# Altium schematic sheet Sheet2.SchDoc
size A3; SheetNumber: 1; SheetTotal: 3
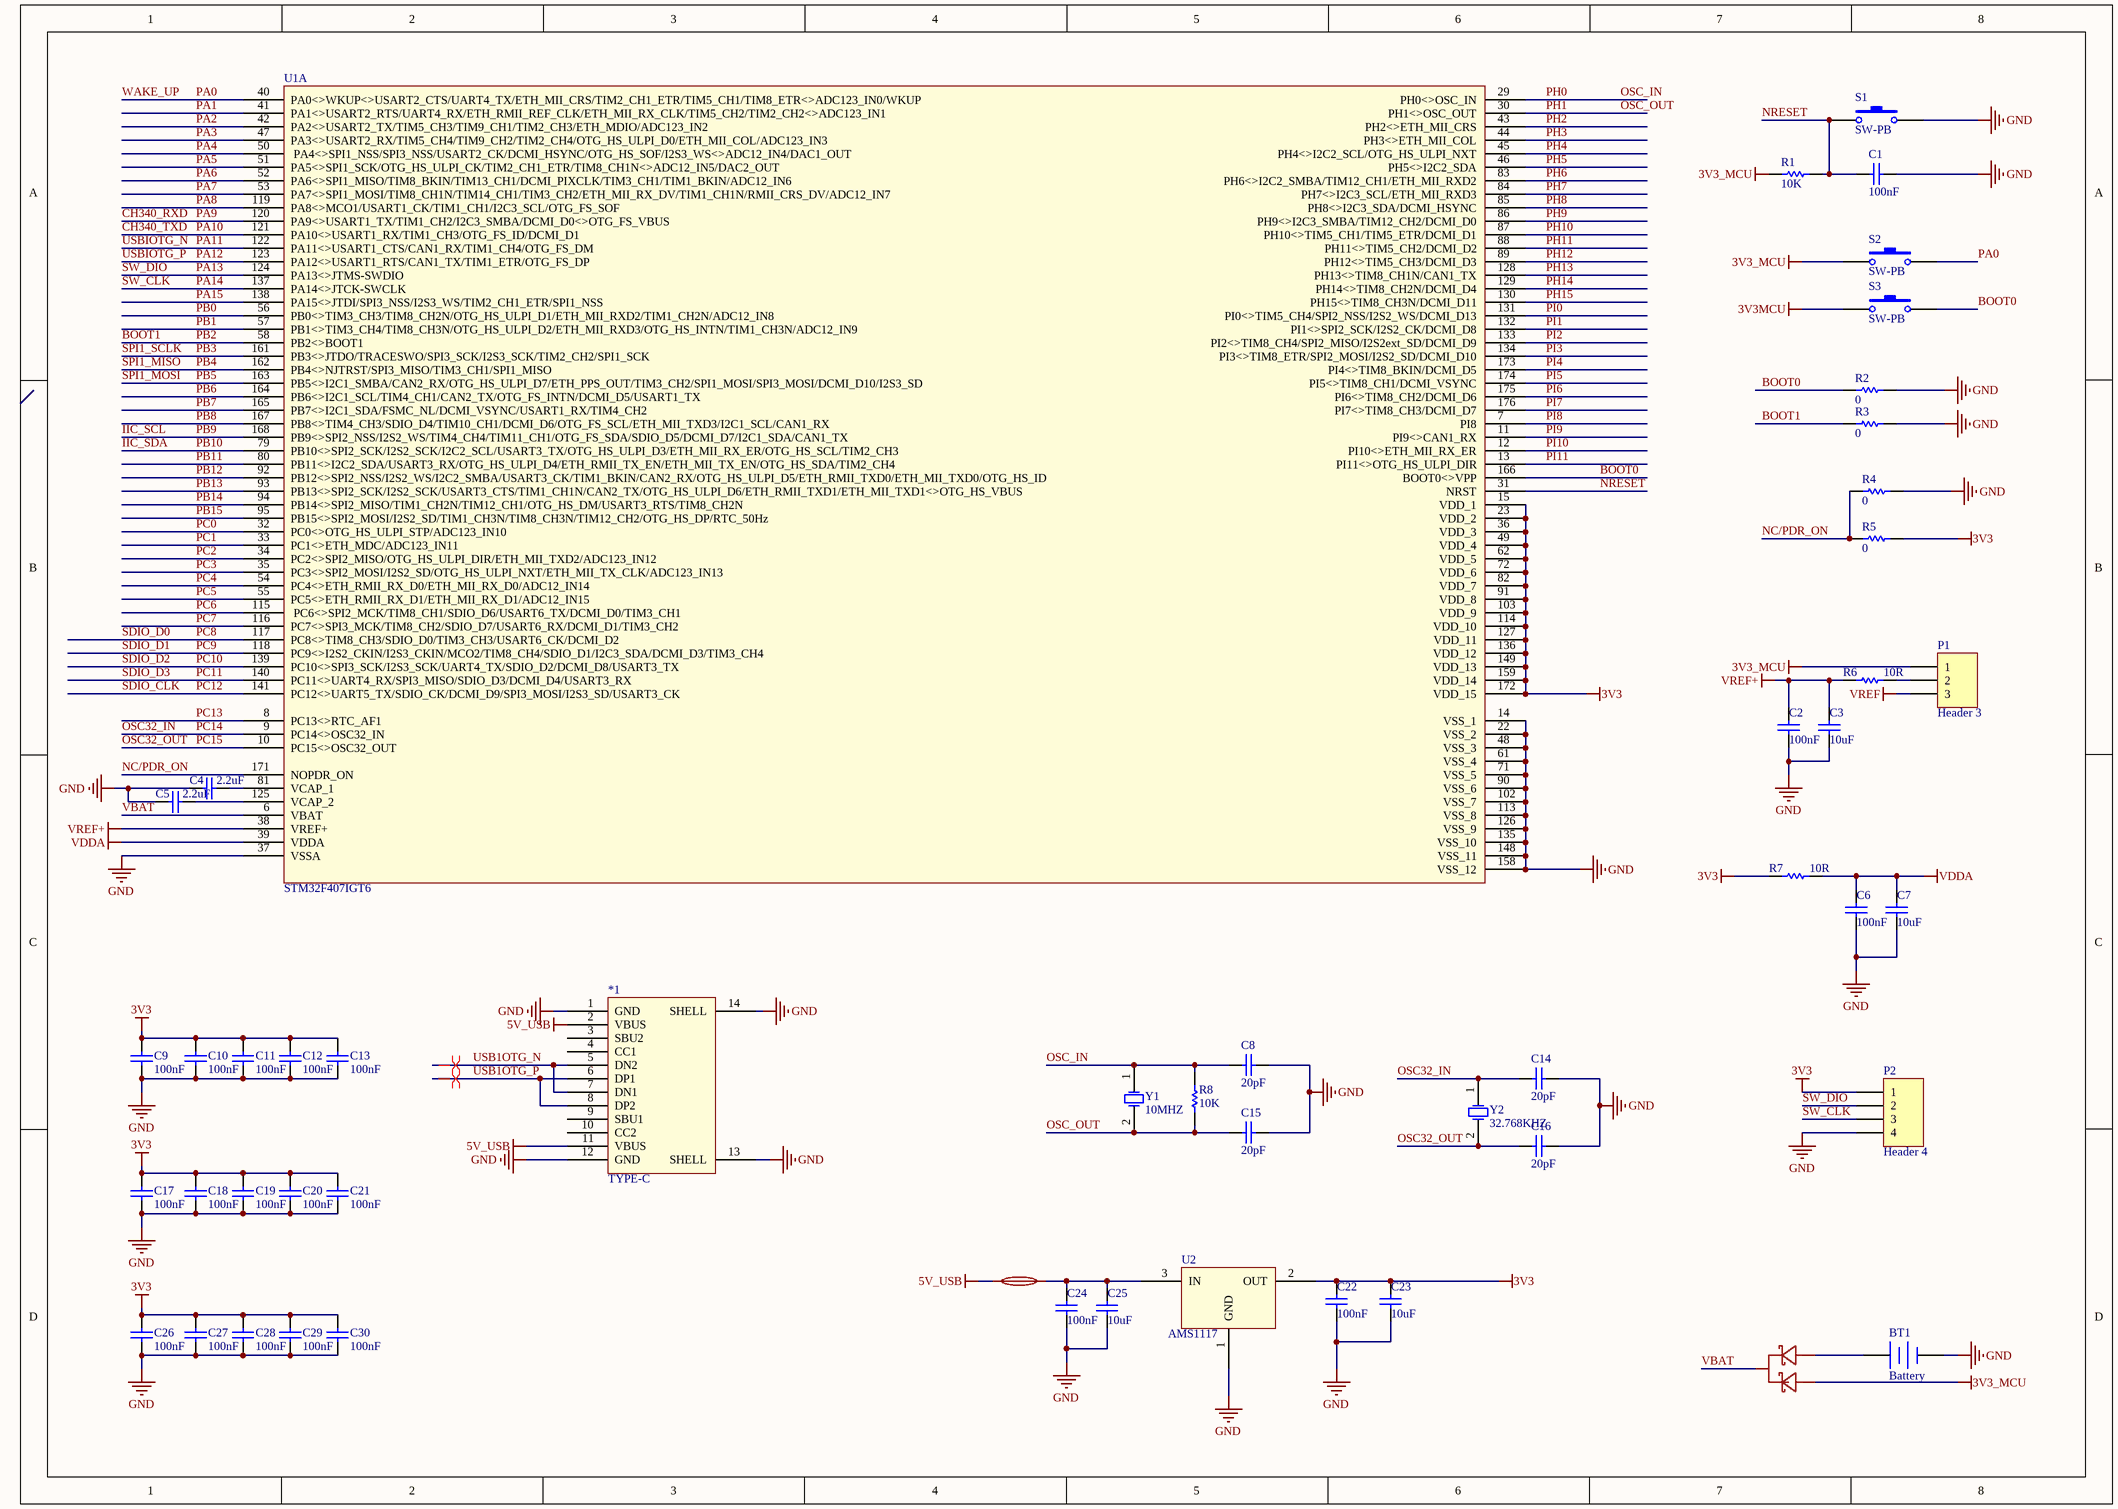
[diagram p0: Sheet2.SchDoc]

## Parts
*1  TYPE-C  [USB-C-SMD_TYPE-C-6PIN-2MD-073]
BT1  Battery  [BAT-SMD_CR1220-2]
C1  100nF  [C0603]
C2  100nF  [C0603]
C3  10uF  [C0603]
C4  2.2uF  [C0603]
C5  2.2uF  [C0603]
C6  100nF  [C0603]
C7  10uF  [C0603]
C8  20pF  [C0603]
C9  100nF  [C0603]
C10  100nF  [C0603]
C11  100nF  [C0603]
C12  100nF  [C0603]
C13  100nF  [C0603]
C14  20pF  [C0603]
C15  20pF  [C0603]
C16  20pF  [C0603]
C17  100nF  [C0603]
C18  100nF  [C0603]
C19  100nF  [C0603]
C20  100nF  [C0603]
C21  100nF  [C0603]
C22  100nF  [C0603]
C23  10uF  [C0603]
C24  100nF  [C0603]
C25  10uF  [C0603]
C26  100nF  [C0603]
C27  100nF  [C0603]
C28  100nF  [C0603]
C29  100nF  [C0603]
C30  100nF  [C0603]
F1  smd1206-100-30  [F1206]  (value not drawn)
P1  Header 3  [HDR1X3]
P2  Header 4  [CONN-SMD_HCZZ0021-4]
R1  10K  [R0603]
R2  0  [R0603]
R3  0  [R0603]
R4  0  [R0603]
R5  0  [R0603]
R6  10R  [R0603]
R7  10R  [R0603]
R8  10K  [R0603]
S1  SW-PB  [KEY-SMD_L6.2-W3.6-LS8.0]
S2  SW-PB  [KEY-SMD_L6.2-W3.6-LS8.0]
S3  SW-PB  [KEY-SMD_L6.2-W3.6-LS8.0]
U1  STM32F407IGT6  [LQFP-176_L24.0-W24.0-P0.50-BL]  (part A of 2)
U2  AMS1117  [SOT-89-3_L4.5-W2.5-P1.50-LS4.2-BR]
U3  bat54c_c22466350  [SOT-23-3_L2.9-W1.3-P1.90-LS2.4-BR]  (value not drawn)
Y1  10MHZ  [CRYSTAL-SMD_L5.0-W3.2]
Y2  32.768KHZ  [CRYSTAL-SMD_L5.0-W3.2]

## Nets
3V3: C9.1 C10.1 C11.1 C12.1 C13.1 C17.1 C18.1 C19.1 C20.1 C21.1 C22.1 C23.1 C26.1 C27.1 C28.1 C29.1 C30.1 P2.1 R5.1 R7.2 U1.15(VDD_1) U1.23(VDD_2) U1.36(VDD_3) U1.49(VDD_4) U1.62(VDD_5) U1.72(VDD_6) U1.82(VDD_7) U1.91(VDD_8) U1.103(VDD_9) U1.114(VDD_10) U1.127(VDD_11) U1.136(VDD_12) U1.149(VDD_13) U1.159(VDD_14) U1.172(VDD_15) U2.2(OUT)
3V3_MCU: P1.1 R1.2 S2.1 U3.1(A)
3V3MCU: S3.1
5V_USB: *1.2(VBUS) *1.11(VBUS) F1.1
GND: *1.1(GND) *1.12(GND) *1.13(SHELL) *1.14(SHELL) BT1.2(-) C1.2 C2.2 C3.2 C4.2 C5.1 C6.2 C7.2 C8.1 C9.2 C10.2 C11.2 C12.2 C13.2 C14.1 C15.1 C16.1 C17.2 C18.2 C19.2 C20.2 C21.2 C22.2 C23.2 C24.2 C25.2 C26.2 C27.2 C28.2 C29.2 C30.2 P2.4 R2.1 R3.1 R4.1 S1.2 U1.14(VSS_1) U1.22(VSS_2) U1.37(VSSA) U1.48(VSS_3) U1.61(VSS_4) U1.71(VSS_5) U1.90(VSS_6) U1.102(VSS_7) U1.113(VSS_8) U1.126(VSS_9) U1.135(VSS_10) U1.148(VSS_11) U1.158(VSS_12) U2.1(GND)
VDDA: C6.1 C7.1 R7.1 U1.39(VDDA)
VREF: P1.3
VREF+: C2.1 C3.1 R6.2 U1.38(VREF+)
BOOT0: R2.2 S3.2 U1.166(BOOT0<>VPP)
BOOT1: R3.2 U1.58(PB2<>BOOT1)  [also labelled PB2]
CH340_RXD: U1.120(PA9<>USART1_TX/TIM1_CH2/I2C3_SMBA/DCMI_D0<>OTG_FS_VBUS)  [also labelled PA9]
CH340_TXD: U1.121(PA10<>USART1_RX/TIM1_CH3/OTG_FS_ID/DCMI_D1)  [also labelled PA10]
IIC_SCL: U1.168(PB9<>SPI2_NSS/I2S2_WS/TIM4_CH4/TIM11_CH1/OTG_FS_SDA/SDIO_D5/DCMI_D7/I2C1_SDA/CAN1_TX)  [also labelled PB9]
IIC_SDA: U1.79(PB10<>SPI2_SCK/I2S2_SCK/I2C2_SCL/USART3_TX/OTG_HS_ULPI_D3/ETH_MII_RX_ER/OTG_HS_SCL/TIM2_CH3)  [also labelled PB10]
NC/PDR_ON: R4.2 R5.2 U1.171(NOPDR_ON)
NRESET: C1.1 R1.1 S1.1 U1.31(NRST)
OSC32_IN: C14.2 U1.9(PC14<>OSC32_IN) Y2.1(OSC1)  [also labelled PC14]
OSC32_OUT: C16.2 U1.10(PC15<>OSC32_OUT) Y2.2(OSC2)  [also labelled PC15]
OSC_IN: C8.2 R8.1 U1.29(PH0<>OSC_IN) Y1.1(OSC1)  [also labelled PH0]
OSC_OUT: C15.2 R8.2 U1.30(PH1<>OSC_OUT) Y1.2(OSC2)  [also labelled PH1]
PA0: S2.2 U1.40(PA0<>WKUP<>USART2_CTS/UART4_TX/ETH_MII_CRS/TIM2_CH1_ETR/TIM5_CH1/TIM8_ETR<>ADC123_IN0/WKUP)  [also labelled WAKE_UP]
PA1: U1.41(PA1<>USART2_RTS/UART4_RX/ETH_RMII_REF_CLK/ETH_MII_RX_CLK/TIM5_CH2/TIM2_CH2<>ADC123_IN1)
PA2: U1.42(PA2<>USART2_TX/TIM5_CH3/TIM9_CH1/TIM2_CH3/ETH_MDIO/ADC123_IN2)
PA3: U1.47(PA3<>USART2_RX/TIM5_CH4/TIM9_CH2/TIM2_CH4/OTG_HS_ULPI_D0/ETH_MII_COL/ADC123_IN3)
PA4: U1.50(PA4<>SPI1_NSS/SPI3_NSS/USART2_CK/DCMI_HSYNC/OTG_HS_SOF/I2S3_WS<>ADC12_IN4/DAC1_OUT)
PA5: U1.51(PA5<>SPI1_SCK/OTG_HS_ULPI_CK/TIM2_CH1_ETR/TIM8_CH1N<>ADC12_IN5/DAC2_OUT)
PA6: U1.52(PA6<>SPI1_MISO/TIM8_BKIN/TIM13_CH1/DCMI_PIXCLK/TIM3_CH1/TIM1_BKIN/ADC12_IN6)
PA7: U1.53(PA7<>SPI1_MOSI/TIM8_CH1N/TIM14_CH1/TIM3_CH2/ETH_MII_RX_DV/TIM1_CH1N/RMII_CRS_DV/ADC12_IN7)
PA8: U1.119(PA8<>MCO1/USART1_CK/TIM1_CH1/I2C3_SCL/OTG_FS_SOF)
PA11: U1.122(PA11<>USART1_CTS/CAN1_RX/TIM1_CH4/OTG_FS_DM)  [also labelled USBIOTG_N]
PA12: U1.123(PA12<>USART1_RTS/CAN1_TX/TIM1_ETR/OTG_FS_DP)  [also labelled USBIOTG_P]
PA13: P2.2 U1.124(PA13<>JTMS-SWDIO)  [also labelled SW_DIO]
PA14: P2.3 U1.137(PA14<>JTCK-SWCLK)  [also labelled SW_CLK]
PA15: U1.138(PA15<>JTDI/SPI3_NSS/I2S3_WS/TIM2_CH1_ETR/SPI1_NSS)
PB0: U1.56(PB0<>TIM3_CH3/TIM8_CH2N/OTG_HS_ULPI_D1/ETH_MII_RXD2/TIM1_CH2N/ADC12_IN8)
PB1: U1.57(PB1<>TIM3_CH4/TIM8_CH3N/OTG_HS_ULPI_D2/ETH_MII_RXD3/OTG_HS_INTN/TIM1_CH3N/ADC12_IN9)
PB3: U1.161(PB3<>JTDO/TRACESWO/SPI3_SCK/I2S3_SCK/TIM2_CH2/SPI1_SCK)  [also labelled SPI1_SCLK]
PB4: U1.162(PB4<>NJTRST/SPI3_MISO/TIM3_CH1/SPI1_MISO)  [also labelled SPI1_MISO]
PB5: U1.163(PB5<>I2C1_SMBA/CAN2_RX/OTG_HS_ULPI_D7/ETH_PPS_OUT/TIM3_CH2/SPI1_MOSI/SPI3_MOSI/DCMI_D10/I2S3_SD)  [also labelled SPI1_MOSI]
PB6: U1.164(PB6<>I2C1_SCL/TIM4_CH1/CAN2_TX/OTG_FS_INTN/DCMI_D5/USART1_TX)
PB7: U1.165(PB7<>I2C1_SDA/FSMC_NL/DCMI_VSYNC/USART1_RX/TIM4_CH2)
PB8: U1.167(PB8<>TIM4_CH3/SDIO_D4/TIM10_CH1/DCMI_D6/OTG_FS_SCL/ETH_MII_TXD3/I2C1_SCL/CAN1_RX)
PB11: U1.80(PB11<>I2C2_SDA/USART3_RX/OTG_HS_ULPI_D4/ETH_RMII_TX_EN/ETH_MII_TX_EN/OTG_HS_SDA/TIM2_CH4)
PB12: U1.92(PB12<>SPI2_NSS/I2S2_WS/I2C2_SMBA/USART3_CK/TIM1_BKIN/CAN2_RX/OTG_HS_ULPI_D5/ETH_RMII_TXD0/ETH_MII_TXD0/OTG_HS_ID)
PB13: U1.93(PB13<>SPI2_SCK/I2S2_SCK/USART3_CTS/TIM1_CH1N/CAN2_TX/OTG_HS_ULPI_D6/ETH_RMII_TXD1/ETH_MII_TXD1<>OTG_HS_VBUS)
PB14: U1.94(PB14<>SPI2_MISO/TIM1_CH2N/TIM12_CH1/OTG_HS_DM/USART3_RTS/TIM8_CH2N)
PB15: U1.95(PB15<>SPI2_MOSI/I2S2_SD/TIM1_CH3N/TIM8_CH3N/TIM12_CH2/OTG_HS_DP/RTC_50Hz)
PC0: U1.32(PC0<>OTG_HS_ULPI_STP/ADC123_IN10)
PC1: U1.33(PC1<>ETH_MDC/ADC123_IN11)
PC2: U1.34(PC2<>SPI2_MISO/OTG_HS_ULPI_DIR/ETH_MII_TXD2/ADC123_IN12)
PC3: U1.35(PC3<>SPI2_MOSI/I2S2_SD/OTG_HS_ULPI_NXT/ETH_MII_TX_CLK/ADC123_IN13)
PC4: U1.54(PC4<>ETH_RMII_RX_D0/ETH_MII_RX_D0/ADC12_IN14)
PC5: U1.55(PC5<>ETH_RMII_RX_D1/ETH_MII_RX_D1/ADC12_IN15)
PC6: U1.115(PC6<>SPI2_MCK/TIM8_CH1/SDIO_D6/USART6_TX/DCMI_D0/TIM3_CH1)
PC7: U1.116(PC7<>SPI3_MCK/TIM8_CH2/SDIO_D7/USART6_RX/DCMI_D1/TIM3_CH2)
PC8: U1.117(PC8<>TIM8_CH3/SDIO_D0/TIM3_CH3/USART6_CK/DCMI_D2)  [also labelled SDIO_D0]
PC9: U1.118(PC9<>I2S2_CKIN/I2S3_CKIN/MCO2/TIM8_CH4/SDIO_D1/I2C3_SDA/DCMI_D3/TIM3_CH4)  [also labelled SDIO_D1]
PC10: U1.139(PC10<>SPI3_SCK/I2S3_SCK/UART4_TX/SDIO_D2/DCMI_D8/USART3_TX)  [also labelled SDIO_D2]
PC11: U1.140(PC11<>UART4_RX/SPI3_MISO/SDIO_D3/DCMI_D4/USART3_RX)  [also labelled SDIO_D3]
PC12: U1.141(PC12<>UART5_TX/SDIO_CK/DCMI_D9/SPI3_MOSI/I2S3_SD/USART3_CK)  [also labelled SDIO_CLK]
PC13: U1.8(PC13<>RTC_AF1)
PH2: U1.43(PH2<>ETH_MII_CRS)
PH3: U1.44(PH3<>ETH_MII_COL)
PH4: U1.45(PH4<>I2C2_SCL/OTG_HS_ULPI_NXT)
PH5: U1.46(PH5<>I2C2_SDA)
PH6: U1.83(PH6<>I2C2_SMBA/TIM12_CH1/ETH_MII_RXD2)
PH7: U1.84(PH7<>I2C3_SCL/ETH_MII_RXD3)
PH8: U1.85(PH8<>I2C3_SDA/DCMI_HSYNC)
PH9: U1.86(PH9<>I2C3_SMBA/TIM12_CH2/DCMI_D0)
PH10: U1.87(PH10<>TIM5_CH1/TIM5_ETR/DCMI_D1)
PH11: U1.88(PH11<>TIM5_CH2/DCMI_D2)
PH12: U1.89(PH12<>TIM5_CH3/DCMI_D3)
PH13: U1.128(PH13<>TIM8_CH1N/CAN1_TX)
PH14: U1.129(PH14<>TIM8_CH2N/DCMI_D4)
PH15: U1.130(PH15<>TIM8_CH3N/DCMI_D11)
PI0: U1.131(PI0<>TIM5_CH4/SPI2_NSS/I2S2_WS/DCMI_D13)
PI1: U1.132(PI1<>SPI2_SCK/I2S2_CK/DCMI_D8)
PI2: U1.133(PI2<>TIM8_CH4/SPI2_MISO/I2S2ext_SD/DCMI_D9)
PI3: U1.134(PI3<>TIM8_ETR/SPI2_MOSI/I2S2_SD/DCMI_D10)
PI4: U1.173(PI4<>TIM8_BKIN/DCMI_D5)
PI5: U1.174(PI5<>TIM8_CH1/DCMI_VSYNC)
PI6: U1.175(PI6<>TIM8_CH2/DCMI_D6)
PI7: U1.176(PI7<>TIM8_CH3/DCMI_D7)
PI8: U1.7(PI8)
PI9: U1.11(PI9<>CAN1_RX)
PI10: U1.12(PI10<>ETH_MII_RX_ER)
PI11: U1.13(PI11<>OTG_HS_ULPI_DIR)
USB1OTG_N: *1.5(DN2) *1.7(DN1)
USB1OTG_P: *1.6(DP1) *1.8(DP2)
VBAT: U1.6(VBAT) U3.3(K)
NetBT1_1: BT1.1(+) U3.2(A)
NetC4_1: C4.1 U1.81(VCAP_1)
NetC5_2: C5.2 U1.125(VCAP_2)
NetC24_1: C24.1 C25.1 F1.2 U2.3(IN)
NetP1_2: P1.2 R6.1

Not connected (* = marked no-connect by the designer): *1 3(SBU2) 4(CC1) 9(SBU1) 10(CC2)

## Layout directives
differential pair: USB1OTG_N, USB1OTG_P

## Library data of the parts
BT1 = Battery: Multicell Battery; Published: 24-Mar-1999; LatestRevisionDate: 17-Jul-2002; LatestRevisionNote: Re-released for DXP Platform.; PackageReference: BAT-2; Publisher: Altium Limited; PackageDescription: Battery; 2 Leads
C1-C30 = Cap: Capacitor; Value: 100pF; Published: 8-Jun-2000; LatestRevisionDate: 17-Jul-2002; LatestRevisionNote: Re-released for DXP Platform.; PackageReference: RAD-0.3; Publisher: Altium Limited; PackageDescription: Radial Cap, Thru-Hole; 2 Leads; 0.3 in Pin Spacing
F1 = smd1206-100-30: 耐压(Vmax):30V;最大电流(Imax):40A;保持电流(Ihold):1A;跳闸电流(Itrip):1.8A;; Manufacturer: R+O(宏嘉诚); AddInBom: yes; ModelId: f1628daad26847a79b887277a2bc8541; ModelName: F1206_L3.2-W1.7-H0.6; ModelTransform: 125.984,66.929,0,0,0,0,0,0,0; Voltage - Max: 30V; Current - Max: 40A; Hold Current: 1A; Trip Current: 1.8A; Power Dissipation: 1W; Resistance - Initial (Ri) (Min): 50mΩ; Resistance - Post Trip (R1) (Max): 300mΩ; Time to Trip(Max): 300ms; Symbol: SMD1206-100-30; LCSC Part Name: 30V 1A; SupplierPart: C46641026; ManufacturerPart: SMD1206-100-30; Supplier Footprint: 1206; JLCPCB Part Class: Extended Part; Datasheet: https://item.szlcsc.com/datasheet/SMD1206-100-30/48798732.html; Supplier: LCSC; ConvertToPcb: yes; FootprintName: F1206; Operating Temperature: -40℃~+85℃; Length: 3.6mm; Width: 1.9mm; Height: 1.3mm
P1 = Header 3: Header, 3-Pin; LatestRevisionDate: 17-Jul-2002; LatestRevisionNote: Re-released for DXP Platform.; Publisher: Altium Limited
P2 = Header 4: Header, 4-Pin; LatestRevisionDate: 17-Jul-2002; LatestRevisionNote: Re-released for DXP Platform.; Publisher: Altium Limited
R1-R8 = Res1: Resistor; Value: 1K; Published: 8-Jun-2000; LatestRevisionDate: 17-Jul-2002; LatestRevisionNote: Re-released for DXP Platform.; PackageReference: AXIAL-0.3; Publisher: Altium Limited; PackageDescription: Axial Device, Thru-Hole; 2 Leads; 0.3 in Pin Spacing
S1-S3 = SW-PB: Switch; Published: 24-Mar-1999; LatestRevisionDate: 17-Jul-2002; LatestRevisionNote: Re-released for DXP Platform.; PackageReference: SPST-2; Publisher: Altium Limited; PackageDescription: Switch; 2 Leads
U1 = STM32F407IGT6: mcu
U3 = bat54c_c22466350: 二极管配置:1对共阴极;正向压降(Vf):1V@100mA;直流反向耐压(Vr):30V;整流电流:200mA;; Manufacturer: R+O(宏嘉诚); ManufacturerPart: BAT54C; AddInBom: yes; ModelId: 4be4999f02b344ffbcd0d3b39a4b0072; ModelName: SOT-23-3_L2.9-W1.3-P1.90-LS2.8-BR; ModelTransform: 110.236,114.173,0,0,0,0,0,0,0; Diode Configuration: 1对共阴极; Voltage - DC Reverse(Vr): 30V; Current - Rectified: 200mA; Reverse Leakage Current (Ir): 2uA@25V; Non-Repetitive Peak Forward Surge Current: 600mA; Symbol: BAT54C_C22466350; LCSC Part Name: 电压:30V 电流:0.2A; SupplierPart: C22466350; Supplier Footprint: SOT-23; JLCPCB Part Class: Extended Part; Datasheet: https://item.szlcsc.com/datasheet/BAT54C/24165509.html; Supplier: LCSC; ConvertToPcb: yes; FootprintName: SOT-23-3_L2.9-W1.3-P1.90-LS2.8-BR; Voltage - Forward(Vf@If): 1V@100mA; Operating Junction Temperature Range: -
Y1 Y2 = XTAL: Crystal Oscillator; Published: 8-Jun-2000; LatestRevisionDate: 17-Jul-2002; LatestRevisionNote: Re-released for DXP Platform.; PackageReference: R38; Publisher: Altium Limited; PackageDescription: Crystal, Thru-Hole; 2 Leads; Body 3.1 x 8.2 mm (Dia.xH)